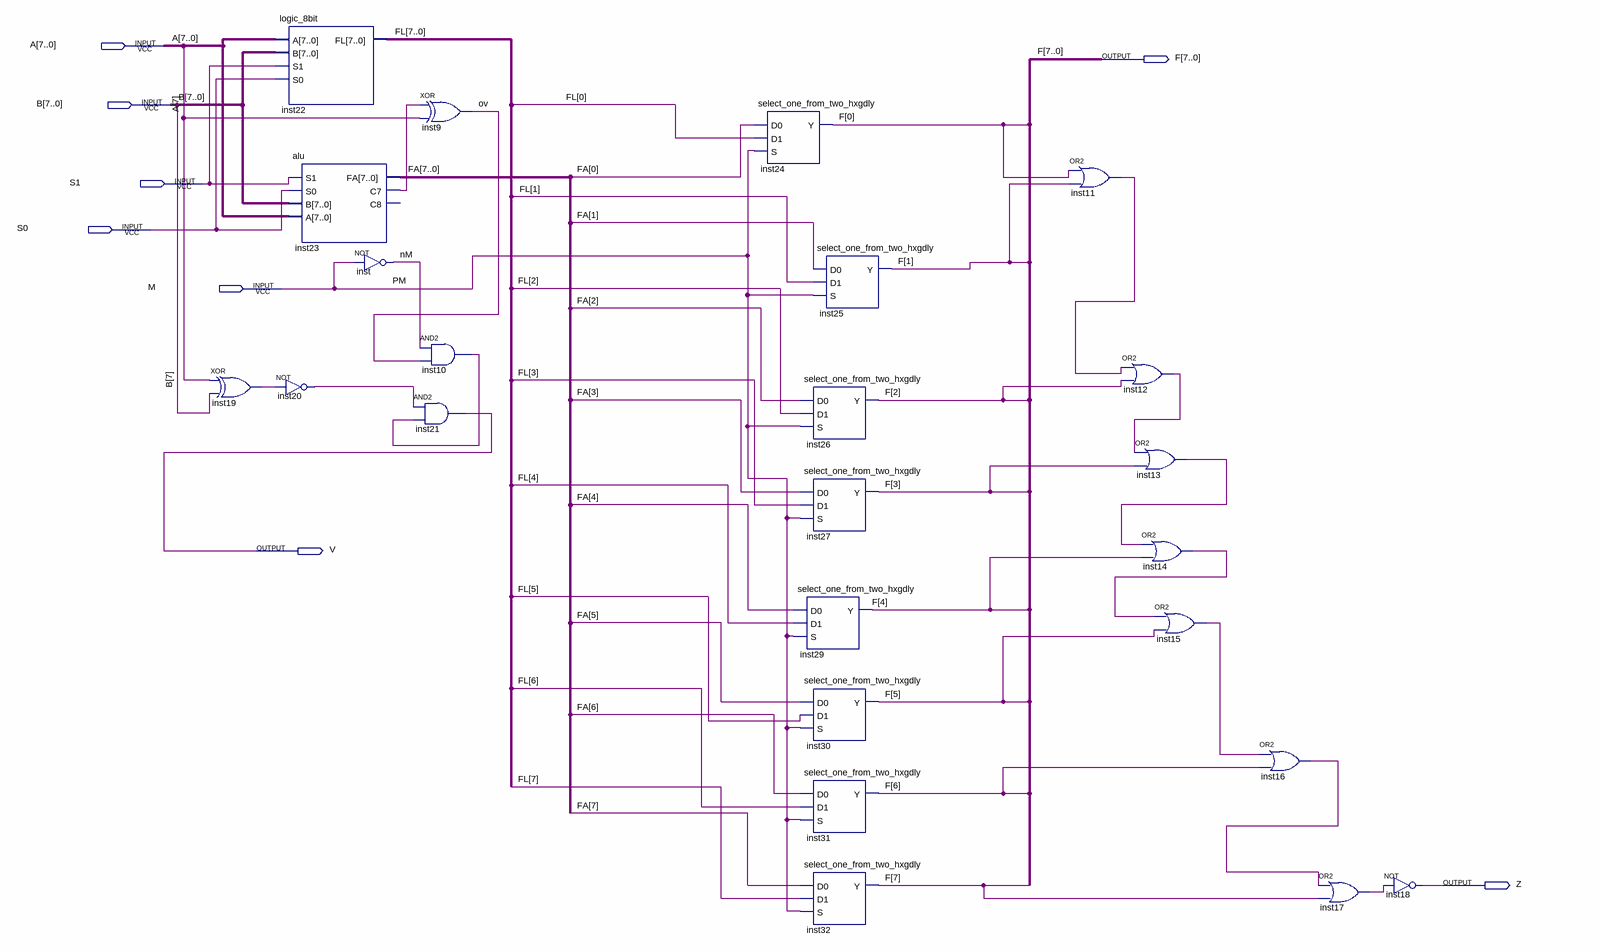
[diagram p0: schematic sheet]
// Quartus schematic alu_byhxg.bdf as structural Verilog: 24 symbols, 8 pins
module alu_byhxg (
  input  [7:0] A,
  input  [7:0] B,
  input  S1,
  input  S0,
  input  M,
  output [7:0] F,
  output V,
  output Z
);

  wire inst10_out, inst11_out, inst12_out, inst13_out, inst14_out, inst15_out, inst16_out, inst17_out,
       inst19_out, inst20_out, inst23_c7, nM, ov;
  wire [7:0] FA, FL;

  xor inst19 (inst19_out, A[7], B[7]);
  logic_8bit inst22 (.A(A), .B(B), .S1(S1), .S0(S0), .FL(FL));
  alu inst23 (.S1(S1), .S0(S0), .B(B), .A(A), .FA(FA), .C7(inst23_c7));  // open: C8
  not inst20 (inst20_out, inst19_out);
  not inst (nM, M);
  xor inst9 (ov, inst23_c7, A[7]);
  and inst10 (inst10_out, nM, ov);
  and inst21 (V, inst20_out, inst10_out);
  select_one_from_two_hxgdly inst24 (.D0(FA[0]), .D1(FL[0]), .S(M), .Y(F[0]));
  select_one_from_two_hxgdly inst25 (.D0(FA[1]), .D1(FL[1]), .S(M), .Y(F[1]));
  select_one_from_two_hxgdly inst26 (.D0(FA[2]), .D1(FL[2]), .S(M), .Y(F[2]));
  select_one_from_two_hxgdly inst27 (.D0(FA[3]), .D1(FL[3]), .S(M), .Y(F[3]));
  select_one_from_two_hxgdly inst29 (.D0(FA[4]), .D1(FL[4]), .S(M), .Y(F[4]));
  select_one_from_two_hxgdly inst30 (.D0(FA[5]), .D1(FL[5]), .S(M), .Y(F[5]));
  select_one_from_two_hxgdly inst31 (.D0(FA[6]), .D1(FL[6]), .S(M), .Y(F[6]));
  select_one_from_two_hxgdly inst32 (.D0(FA[7]), .D1(FL[7]), .S(M), .Y(F[7]));
  or inst11 (inst11_out, F[0], F[1]);
  or inst12 (inst12_out, inst11_out, F[2]);
  or inst13 (inst13_out, inst12_out, F[3]);
  or inst14 (inst14_out, inst13_out, F[4]);
  or inst15 (inst15_out, inst14_out, F[5]);
  or inst16 (inst16_out, inst15_out, F[6]);
  or inst17 (inst17_out, inst16_out, F[7]);
  not inst18 (Z, inst17_out);

  // Other names for the same wires on the sheet: PM = M
endmodule
